# Altium schematic sheet IDC Conn.SchDoc: Top Panel IDC Connector
size A4; ApprovedBy: LD Stanton; Author: LD Stanton; CompanyName: University of Cape Town; DrawnBy: Lawrence Stanton; Engineer: Lawrence Stanton; Organization: University of Cape Town; Address1: Department of Electrical Engineering; Address2: Rondebosch; Address3: Cape Town; Address4: South Africa 7701; DocumentNumber: 3; SheetNumber: 3; SheetTotal: 14
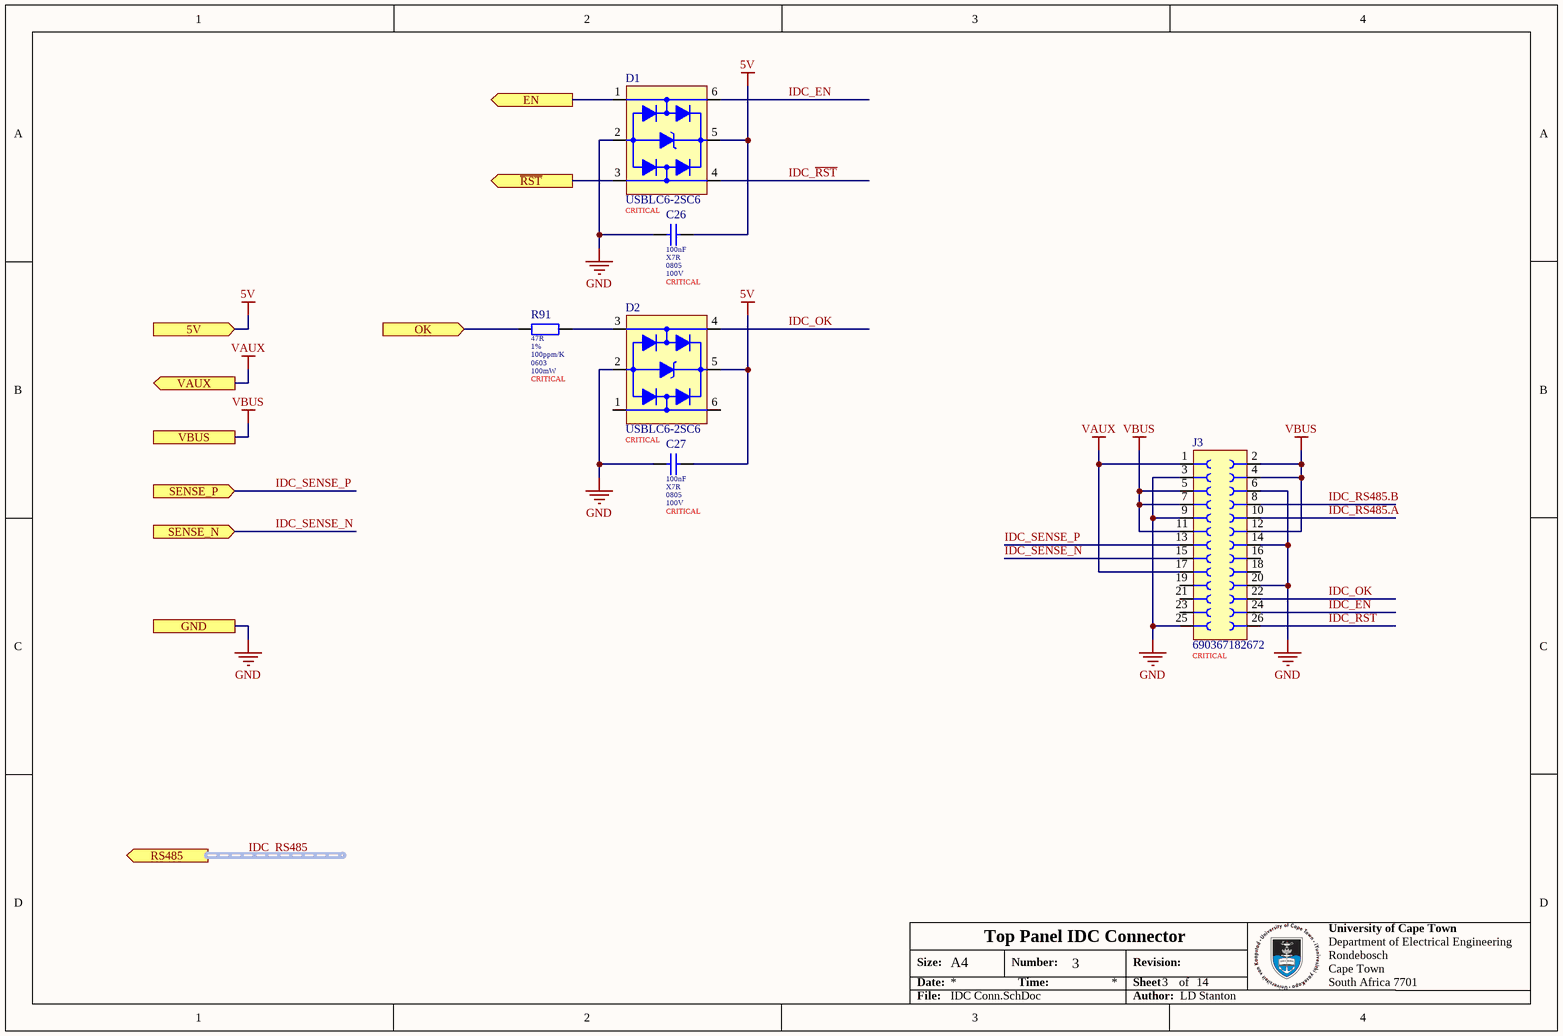
[diagram p0: IDC Conn.SchDoc]

## Parts
C26  value 100nF  Dielectric: X7R  Package: 0805  Voltage: 100V  Populate: CRITICAL  [0805_125_F (Samsumg) B]  (hidden comment: CL21B104KCFNNNE)
C27  value 100nF  Dielectric: X7R  Package: 0805  Voltage: 100V  Populate: CRITICAL  [0805_125_F (Samsumg) B]  (hidden comment: CL21B104KCFNNNE)
D1  USBLC6-2SC6  Placement: CRITICAL  [SOT-23-6 (USBLC6-2SC6 ST) B]
D2  USBLC6-2SC6  Placement: CRITICAL  [SOT-23-6 (USBLC6-2SC6 ST) B]
J3  690367182672  Placement: CRITICAL  [690367182672]
R91  value 47R  Tolerance: 1%  Temperature Coefficient: 100ppm/K  Package: 0603  Power: 100mW  Populate: CRITICAL  [0603 (Uniroyal) B]  (hidden comment: 0603WAF470JT5E)

## Ports
5V (in), EN (out), GND, OK (in), RS485 (out, harness RS485), SENSE_N (in), SENSE_P (in), VAUX (out), VBUS, ~{RST} (out)

## Nets
5V: C26.2 C27.2 D1.5(VBUS) D2.5(VBUS) ; port 5V
GND: C26.1 C27.1 D1.2(GND) D2.2(GND) J3.3 J3.6 J3.9 J3.14 J3.20 J3.25 ; port GND
VAUX: J3.1 J3.17 ; port VAUX
VBUS: J3.2 J3.4 J3.5 J3.7 J3.11 J3.12 ; port VBUS
EN: D1.1(I/O_1) ; port EN
IDC_EN: D1.6(I/O_4) J3.24
IDC_OK: D2.4(I/O_3) J3.22
IDC_~{RST}: D1.4(I/O_3) J3.26
IDC_RS485.A: J3.10
IDC_RS485.B: J3.8
IDC_SENSE_N: J3.15 ; port SENSE_N
IDC_SENSE_P: J3.13 ; port SENSE_P
OK: R91.1 ; port OK
~{RST}: D1.3(I/O_2) ; port ~{RST}
NetD2_3: D2.3(I/O_2) R91.2

Not connected (* = marked no-connect by the designer): D2 1(I/O_1) 6(I/O_4); J3 16 18 19 21 23

## Buses and harness runs
harness IDC_RS485 = port RS485

## Notes on the sheet
- Size:
- Date:
- A4
- Number:
- Time:
- Revision:
- Sheet
- of
- File:
- Author:

## Library data of the parts
C26 C27 = CMP-00100-3: MLCC 100nF 0805 100V X7R ±10%; Manufacturer: Samsung; ComponentLink1URL: https://datasheet.lcsc.com/szlcsc/Samsung-Electro-Mechanics-CL05C100JB5NNNC_C32949.pdf; LCSC Part Number: C28233; ComponentLink1Description: Datasheet; Tolerance: ±10%
D1 D2 = CMP-000039-5: TVS Diode Array Low Capacitance SOT23-6; Manufacturer: ST Microelectronics; Peak Pulse Current: 5A; Data Rate: 480Mbps; Breakdown Voltage: 6V; Leakage Current: 150nA; Clamping Voltage: 17V; Capacitance: 3.5pF; RoHS Compliant: Yes; Min Operating Temperature: -40°C; ComponentLink1URL: https://www.st.com/resource/en/datasheet/usblc6-2.pdf; Case/Package: SOT-23-6; LCSC Part Number: C7519; ComponentLink1Description: Datasheet; Max Operating Temperature: 125°C
J3 = CMP-00118-2: Board Connector, 26 Contact(s), 2 Row(s), Male, Straight, 0.1 inch Pitch, Solder Kinked Leads Terminal, Locking, Red Insulator, Plug; LCSC Part Number: C19131003; ComponentLink2Description: Datasheet; ComponentLink1Description: Product Page; ComponentLink1URL: https://www.we-online.com/en/components/products/BTB_WR-MM_MINIMODULE_THT?sq=690367182672#690367182672; ComponentLink2URL: https://www.we-online.com/components/products/datasheet/690367182672.pdf
R91 = CMP-00128-3: Resistor 47R 0603 ±1% Thick Film Uniroyal; Voltage Rating: 75V; ComponentLink1Description: Datasheet; Min Operating Temperature: -55°C; Manufacturer: Uniroyal; ComponentLink1URL: https://datasheet.lcsc.com/szlcsc/1811062009_UNI-ROYAL-Uniroyal-Elec-0603WAF1002T5E_C25804.pdf; Composition: Thick Film; LCSC Part Number: C23182; Max Operating Temperature: 155°C